# Altium schematic sheet Power.SchDoc
size A4; SheetNumber: 3; SheetTotal: 3
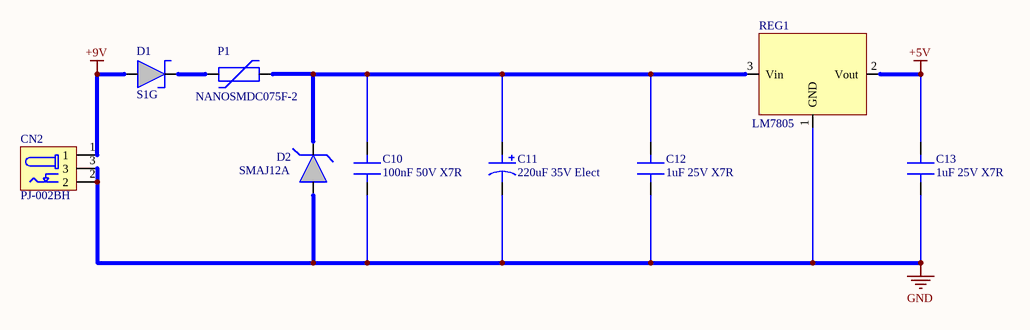
[diagram p0: Power.SchDoc]

## Parts
C10  100nF 50V X7R  [C0805]
C11  220uF 35V Elect  [Capacitor radial 8x11.5]
C12  1uF 25V X7R  [C0805]
C13  1uF 25V X7R  [C0805]
CN2  PJ-002BH  [PJ-002BH]
D1  S1G  [SMA (DO-214AC)]
D2  SMAJ12A  [SMA (DO-214AC)]
P1  NANOSMDC075F-2  [NANOSMDC016F]
REG1  LM7805  [SOT 223]

## Nets
+5V: C13.1 REG1.2(Vout)
+9V: CN2.1 D1.1
GND: C10.2 C11.2 C12.2 C13.2 CN2.2 CN2.3 D2.1 REG1.1(GND)
NetC10_1: C10.1 C11.1 C12.1 D2.2 P1.2 REG1.3(Vin)
NetD1_2: D1.2 P1.1

## Library data of the parts
C10 C12 C13 = Capacitor: Non polarized capacitor
C11 = Polarized Capacitor
CN2 = Power Jack: 3 pins jack
D1 = Schottky Diode
D2 = TVS: Transient voltage suppression diode
P1 = Polyswitch
REG1 = LM78xx: Voltage regulator